# Altium project SX1262_Scan.PrjPcb
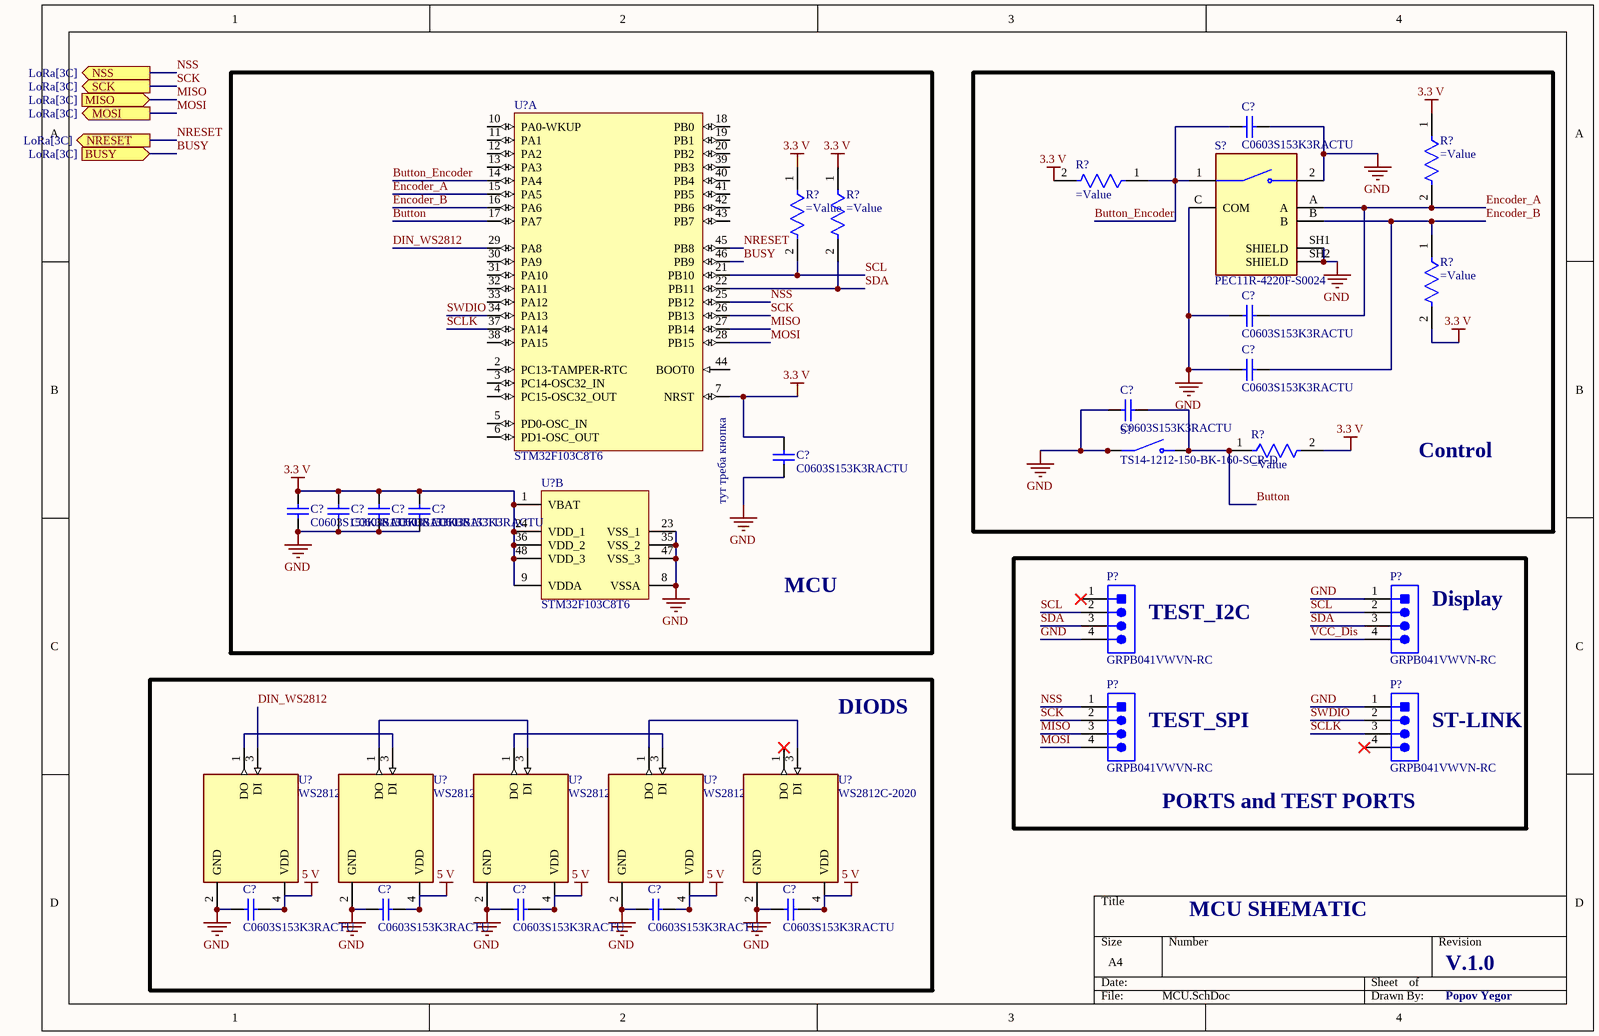
[diagram p0: MCU.SchDoc]
4 sheets, 67 parts. Net scope: flat (ports and power ports of the same name join across sheets).
Sheets:
  Main.SchDoc
  MCU.SchDoc
  LoRa.SchDoc
  Power.SchDoc

## Sheet Main.SchDoc
size A4; SheetNumber: 1; SheetTotal: 3

## Sheet MCU.SchDoc
size A4; SheetNumber: 2; SheetTotal: 4

### Parts
(Parts that share a designator on the sheet are numbered #1, #2 ... from top to bottom, then left to right.)
C?#1  C0603S153K3RACTU  [CAP_0603]
C?#2  C0603S153K3RACTU  [CAP_0603]
C?#3  C0603S153K3RACTU  [CAP_0603]
C?#4  C0603S153K3RACTU  [CAP_0603]
C?#5  C0603S153K3RACTU  [CAP_0603]
C?#6  C0603S153K3RACTU  [CAP_0603]
C?#7  C0603S153K3RACTU  [CAP_0603]
C?#8  C0603S153K3RACTU  [CAP_0603]
C?#9  C0603S153K3RACTU  [CAP_0603]
C?#10  C0603S153K3RACTU  [CAP_0603]
C?#11  C0603S153K3RACTU  [CAP_0603]
C?#12  C0603S153K3RACTU  [CAP_0603]
C?#13  C0603S153K3RACTU  [CAP_0603]
C?#14  C0603S153K3RACTU  [CAP_0603]
P?#1  GRPB041VWVN-RC  [SLIN-GRPB041VWVN-RC_V]
P?#2  GRPB041VWVN-RC  [SLIN-GRPB041VWVN-RC_V]
P?#3  GRPB041VWVN-RC  [SLIN-GRPB041VWVN-RC_V]
P?#4  GRPB041VWVN-RC  [SLIN-GRPB041VWVN-RC_V]
R?#1  (no value)  [Res_0603]
R?#2  (no value)  [Res_0603]
R?#3  (no value)  [Res_0603]
R?#4  (no value)  [Res_0603]
R?#5  (no value)  [Res_0603]
R?#6  (no value)  [Res_0603]
S?#1  PEC11R-4220F-S0024  [XDCR_PEC11R-4220F-S0024]
S?#2  TS14-1212-150-BK-160-SCR-D  [SW_TS14-1212-150-BK-160-SCR-D]
U?#1  STM32F103C8T6  [STM-LQFP48_L]  (part A of 2)
U?#2  STM32F103C8T6  [STM-LQFP48_L]  (part B of 2)
U?#3  WS2812C-2020  [LED_WS2812C-2020]
U?#4  WS2812C-2020  [LED_WS2812C-2020]
U?#5  WS2812C-2020  [LED_WS2812C-2020]
U?#6  WS2812C-2020  [LED_WS2812C-2020]
U?#7  WS2812C-2020  [LED_WS2812C-2020]

### Blocks framed on the sheet
MCU: C?#5-C?#9 R?#2 R?#3 U?#1 U?#2
Control: C?#1-C?#4 R?#1 R?#4-R?#6 S?#1 S?#2
DIODS: C?#10-C?#14 U?#3-U?#7

### Ports
BUSY (in, see LoRa[3C]), MISO (in, see LoRa[3C]), MOSI (out, see LoRa[3C]), NRESET (out, see LoRa[3C]), NSS (out, see LoRa[3C]), SCK (out, see LoRa[3C])

### Nets
3.3 V: C?#5.1 C?#6.1 C?#7.1 C?#8.1 C?#9.1 R?#1.1 R?#2.1 R?#3.1 R?#4.2 R?#5.2 R?#6.2 U?#1.7(NRST) U?#2.1(VBAT) U?#2.9(VDDA) U?#2.24(VDD_1) U?#2.36(VDD_2) U?#2.48(VDD_3)
5 V: C?#10.2 C?#11.2 C?#12.2 C?#13.2 C?#14.2 U?#3.4(VDD) U?#4.4(VDD) U?#5.4(VDD) U?#6.4(VDD) U?#7.4(VDD)
GND: C?#1.1 C?#2.2 C?#3.2 C?#4.1 C?#5.2 C?#6.2 C?#7.2 C?#8.2 C?#9.2 C?#10.1 C?#11.1 C?#12.1 C?#13.1 C?#14.1 P?#1.4 P?#2.1 P?#4.1 S?#1.2 S?#1.C(COM) S?#1.SH1(SHIELD) S?#1.SH2(SHIELD) S?#2.3(COM) S?#2.4(COM) U?#2.8(VSSA) U?#2.23(VSS_1) U?#2.35(VSS_2) U?#2.47(VSS_3) U?#3.2(GND) U?#4.2(GND) U?#5.2(GND) U?#6.2(GND) U?#7.2(GND)
BUSY: U?#1.46(PB9) ; port BUSY
Button: C?#4.2 R?#6.1 S?#2.1(NO) S?#2.2(NO) U?#1.17(PA7)
Button_Encoder: C?#1.2 R?#4.1 S?#1.1 U?#1.14(PA4)
DIN_WS2812: U?#1.29(PA8) U?#3.3(DI)
Encoder_A: C?#2.1 R?#1.2 S?#1.A U?#1.15(PA5)
Encoder_B: C?#3.1 R?#5.1 S?#1.B U?#1.16(PA6)
MISO: P?#3.3 U?#1.27(PB14) ; port MISO
MOSI: P?#3.4 U?#1.28(PB15) ; port MOSI
NRESET: U?#1.45(PB8) ; port NRESET
NSS: P?#3.1 U?#1.25(PB12) ; port NSS
SCK: P?#3.2 U?#1.26(PB13) ; port SCK
SCL: P?#1.2 P?#2.2 R?#2.2 U?#1.21(PB10)
SCLK: P?#4.3 U?#1.37(PA14)
SDA: P?#1.3 P?#2.3 R?#3.2 U?#1.22(PB11)
SWDIO: P?#4.2 U?#1.34(PA13)
VCC_Dis: P?#2.4
NetU?#3_1: U?#3.1(DO) U?#4.3(DI)
NetU?#4_1: U?#4.1(DO) U?#5.3(DI)
NetU?#5_1: U?#5.1(DO) U?#6.3(DI)
NetU?#6_1: U?#6.1(DO) U?#7.3(DI)

Not connected (* = marked no-connect by the designer): P?#1 1*; P?#4 4*; U?#1 2(PC13-TAMPER-RTC) 3(PC14-OSC32_IN) 4(PC15-OSC32_OUT) 5(PD0-OSC_IN) 6(PD1-OSC_OUT) 10(PA0-WKUP) 11(PA1) 12(PA2) 13(PA3) 18(PB0) 19(PB1) 20(PB2) 30(PA9) 31(PA10) 32(PA11) 33(PA12) 38(PA15) 39(PB3) 40(PB4) 41(PB5) 42(PB6) 43(PB7) 44(BOOT0); U?#7 1(DO)*

### Notes on the sheet
- (near U?#1) тут треба кнопка
- (near P?#1) TEST_I2C
- (near P?#2) Display
- (near P?#3) TEST_SPI
- (near P?#4) ST-LINK
- (near P?#4) PORTS and TEST PORTS
- MCU SHEMATIC
- V.1.0
- Popov Yegor

### Library data of the parts
C?#1-C?#14 = CAP_0603: Manufacturer: Kemet; Part Number: C0603S153K3RACTU
P?#1-P?#4 = CMP-2000-06373-1: Male Header, Pitch 1.27 mm, 1 x 4 Position, Height 4 mm, Tail Length 2.3 mm, -40 to 105 degC, RoHS, Bulk; Manufacturer: Sullins; Mating Products: S9010E-04-ND / -CONNHEADER.050"4POSR/APCB / S9008E-04-ND / -CONNHEADER.050"4POSPCBGOLD / S9005E-04-ND / -CONNHEADER.050"4POSSMDGOLD; Other Names: S9014E-04; Dynamic Catalog: GRPB; Pitch: 0.050"(1.27mm); Number of Positions Loaded: All; Number of Positions: 4; Catalog Drawings: S9014ESeriesTop; Connector Type: Header,Unshrouded; Contact Finish Thickness: Flash; Number of Rows: 1; Contact Type: MalePin; Category: Connectors,Interconnects; Contact Mating Length: 0.118"(3.00mm); Family: RectangularConnectors-Headers,MalePins; Datasheet Version: Rev. C, 12/2008; Contact Finish: Gold; Termination: Solder; Manufacturer URL: http://www.sullinscorp.com/; Mounting Type: ThroughHole; Packaging: Bulk; Package Reference: GRPB041VWVN-RC; Datasheet URL: http://www.sullinscorp.com/drawings/71_GRPB___1VWVN-RC,_10957-C.pdf; Mounting Technology: ThroughHole; Package Description: Male Header, Pitch 1.27 mm, 1 x 4 Position, Height 4 mm, Tail Length 2.3 mm; Standard Package: 1
R?#1-R?#6 = R_0603: 1.54kΩ ±1% 0.1W 0603 Thick Film Chip Resistor AEC-Q200 compliant; Resistance: 1.54kR; Temperature Coefficient: 200ppm/°C; Max Operating Temperature: 155°C; Radiation Hardening: No; Packaging: Tape and Reel; Case/Package: 0603; Min Operating Temperature: -55°C; Mount: Surface Mount; Resistor Type: Thick Film; Tolerance: 1%; RoHS Compliant: Yes
S?#1 = PEC11R-4220F-S0024: MF: {'manufacturer': u'Bourns Inc.'}; Package: None; Price: None; Value: *; MP: PEC11R-4220F-S0024; Availability: Unavailable
S?#2 = TS14-1212-150-BK-160-SCR-D: 12 x 12 mm, 15 mm Actuator Height, 160 gf, Short Crimped, Black, Through Hole, SPST, Tactile Switch; MF: Same Sky; SnapEDA_Link: https://www.snapeda.com/parts/TS14-1212-150-BK-160-SCR-D/Same+Sky/view-part/?ref=snap; Package: None; Value: *; MP: TS14-1212-150-BK-160-SCR-D; Check_prices: https://www.snapeda.com/parts/TS14-1212-150-BK-160-SCR-D/Same+Sky/view-part/?ref=eda
U?#1 U?#2 = CMP-0237-00215-3: ARM Cortex-M3 32-bit MCU, 64 KB Flash, 20 KB Internal RAM, 37 I/Os, 48-pin LQFP, -40 to 85 degC, Tray; Supply Voltage(Vcc) min (V): 2; Internal RAM Size (kB): 20; FLASH Size (Prog) (kB): 64; A/D Converter: 2x12-bit (10 Channel); I/Os (High Current): 37; Operating Frequency(F) (Processor speed) (MHz): 72; Core: ARM Cortex-M3; ComponentLink3Description: Package Specification; Mounting Technology: Surface Mount; PartNumber: STM32F103C8T6; PackageReference: LQFP48; Packing: Tray; ComponentLink3URL: http://www.st.com/st-web-ui/static/active/en/resource/technical/document/datasheet/DM00058181.pdf; DatasheetVersion: Rev. 16; ComponentLink1URL: http://www.st.com/web/en/home.html; PackageVersion: Rev. 6, 06/2013; ComponentLink2URL: http://www.st.com/st-web-ui/static/active/en/resource/technical/document/datasheet/CD00161566.pdf; ComponentLink1Description: Manufacturer URL; ComponentLink2Description: Datasheet; PackageDescription: 48-Pin Low Profile Quad Flat Package, 7 x 7 mm Body, 0.5 mm Pitch
U?#3-U?#7 = WS2812C-2020: Intelligent control LED integrated light source; MF: Worldsemi; SnapEDA_Link: https://www.snapeda.com/parts/WS2812C-2020/Worldsemi/view-part/?ref=snap; Package: Package; Value: *; MP: WS2812C-2020; Check_prices: https://www.snapeda.com/parts/WS2812C-2020/Worldsemi/view-part/?ref=eda

## Sheet LoRa.SchDoc
size A4; SheetNumber: 3; SheetTotal: 4
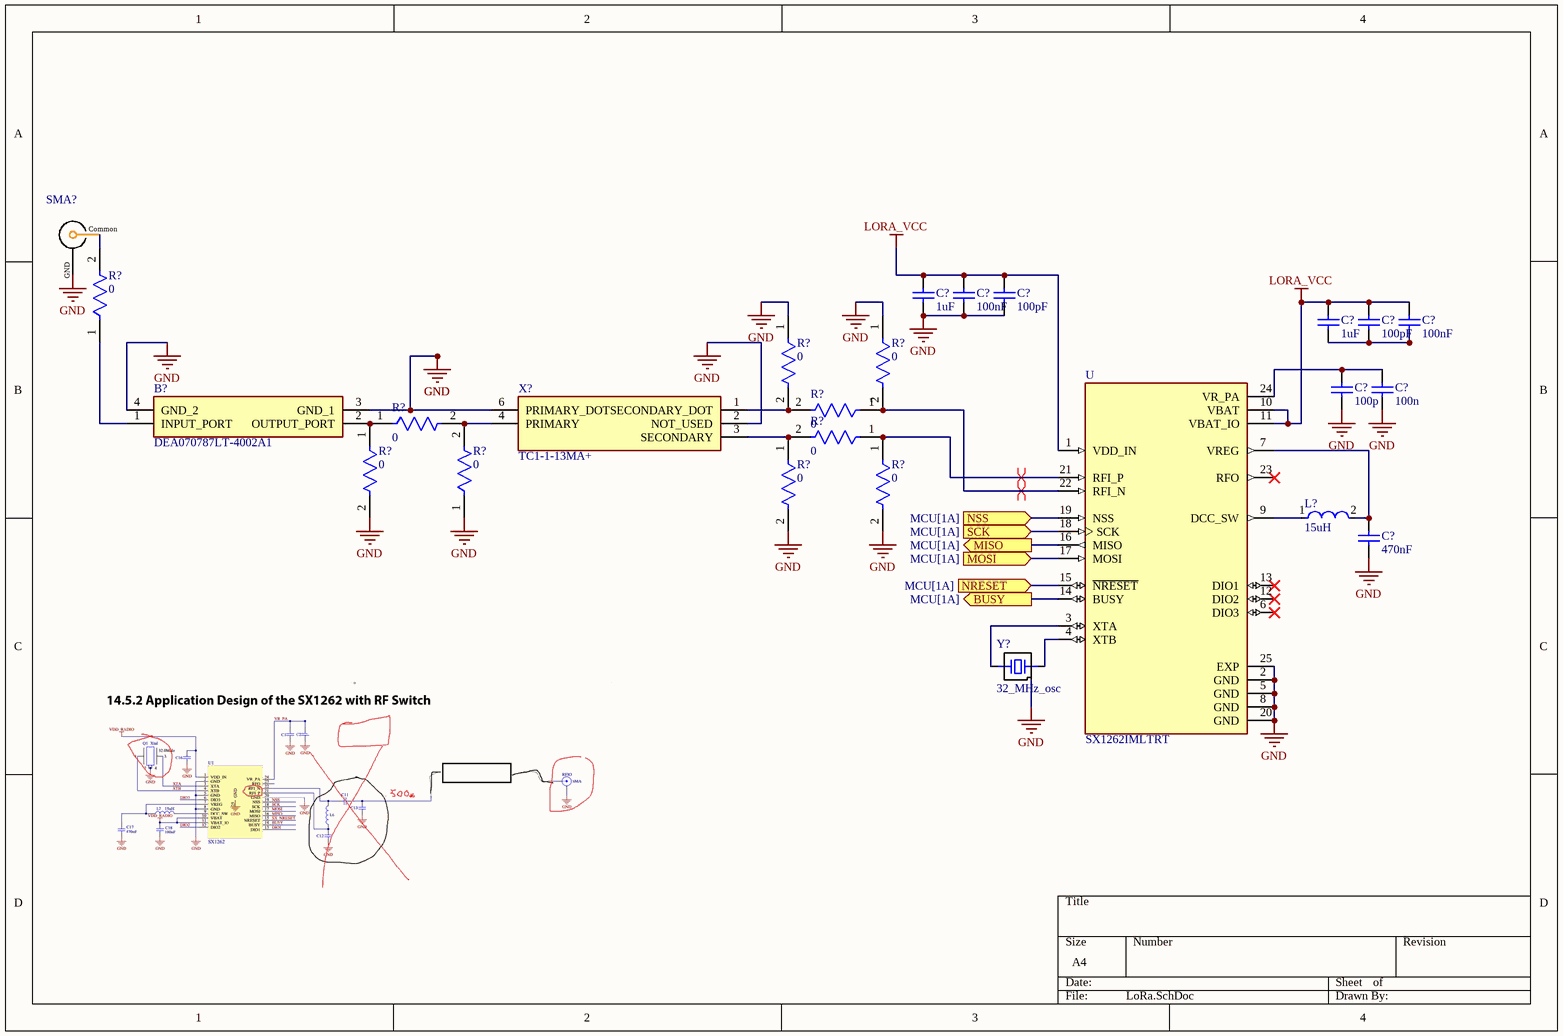
[diagram p1: LoRa.SchDoc]

### Parts
(Parts that share a designator on the sheet are numbered #1, #2 ... from top to bottom, then left to right.)
B?#1  DEA070787LT-4002A1  [DEA070787LT4002A1]
C?#15  1uF  [CAP_0402]
C?#16  100nF  [CAP_0402]
C?#17  100pF  [CAP_0402]
C?#18  1uF  [CAP_0402]
C?#19  100pF  [CAP_0402]
C?#20  100nF  [CAP_0402]
C?#21  100p  [CAP_0402]
C?#22  100n  [CAP_0402]
C?#23  470nF  [CAP_0402]
L?  15uH  [L_0402]
R?#7  0  [Res_0402]
R?#8  0  [Res_0402]
R?#9  0  [Res_0402]
R?#10  0  [Res_0402]
R?#11  0  [Res_0402]
R?#12  0  [Res_0402]
R?#13  0  [Res_0402]
R?#14  0  [Res_0402]
R?#15  0  [Res_0402]
R?#16  0  [Res_0402]
SMA?  SMA  [SMA_BWSMA-KE11]  (value not drawn)
U  SX1262IMLTRT  [QFN50P400X400X100-25N]
X?  TC1-1-13MA+  [TC1113MA]
Y?  32_MHz_osc  [SMD3225-4P]

### Ports
BUSY (out, see MCU[1A]), MISO (out, see MCU[1A]), MOSI (in, see MCU[1A]), NRESET (in, see MCU[1A]), NSS (in, see MCU[1A]), SCK (in, see MCU[1A])

### Nets
GND: B?#1.3(GND_1) B?#1.4(GND_2) C?#15.1 C?#16.1 C?#17.1 C?#21.1 C?#22.1 C?#23.1 R?#7.1 R?#8.1 R?#12.2 R?#13.2 R?#15.2 R?#16.1 SMA?.GND U.2(GND) U.5(GND) U.8(GND) U.20(GND) U.25(EXP) X?.2(NOT_USED) X?.6(PRIMARY_DOT) Y?.GND
LORA_VCC: C?#15.2 C?#16.2 C?#17.2 C?#18.2 C?#19.2 C?#20.2 U.1(VDD_IN) U.10(VBAT) U.11(VBAT_IO)
BUSY: U.14(BUSY) ; port BUSY
MISO: U.16(MISO) ; port MISO
MOSI: U.17(MOSI) ; port MOSI
NRESET: U.15(~{NRESET}) ; port NRESET
NSS: U.19(NSS) ; port NSS
SCK: U.18(SCK) ; port SCK
NetB?#1_1: B?#1.1(INPUT_PORT) R?#9.1
NetB?#1_2: B?#1.2(OUTPUT_PORT) R?#11.1 R?#12.1
NetC?#18_1: C?#18.1 C?#19.1 C?#20.1
NetC?#21_2: C?#21.2 C?#22.2 U.24(VR_PA)
NetC?#23_2: C?#23.2 L?.2 U.7(VREG)
NetL?_1: L?.1 U.9(DCC_SW)
NetR?#7_2: R?#7.2 R?#10.2 X?.1(SECONDARY_DOT)
NetR?#8_2: R?#8.2 R?#10.1 U.22(RFI_N)
NetR?#9_2: R?#9.2 SMA?.Common
NetR?#11_2: R?#11.2 R?#16.2 X?.4(PRIMARY)
NetR?#13_1: R?#13.1 R?#14.2 X?.3(SECONDARY)
NetR?#14_1: R?#14.1 R?#15.1 U.21(RFI_P)
NetU_3: U.3(XTA) Y?.IN
NetU_4: U.4(XTB) Y?.OUT

Not connected (* = marked no-connect by the designer): U 6(DIO3)* 12(DIO2)* 13(DIO1)* 23(RFO)*

### Layout directives
differential pair: NetR?#8_2, NetR?#14_1

### Library data of the parts
B?#1 = DEA070787LT-4002A1: Filters, Pass Band=777 to 787MHz, Zc=50se; Manufacturer_Name: TDK; Geometry.Height: 0.3mm; Mouser Part Number: 810-DEA070787LT42A1; Mouser Price/Stock: https://www.mouser.co.uk/ProductDetail/TDK/DEA070787LT-4002A1?qs=t7xnP681wgWsMS%252BzXDdMJg%3D%3D; Manufacturer_Part_Number: DEA070787LT-4002A1; Datasheet Link: https://product.tdk.com/system/files/dam/doc/product/rf/rf/filter/catalog/rf_lpf_dea070787lt-4002a1_en.pdf
C?#15-C?#23 = CAP_0402: Part Number: C0402T103K4RACTU; Manufacturer: Kemet
  C?#15 C?#18: Value: 1uF
  C?#16 C?#20: Value: 100nF
  C?#17 C?#19: Value: 100pF
  C?#21: Value: 100p
  C?#22: Value: 100n
  C?#23: Value: 470nF
L? = L_0402: Wire Wound Ferrite type RF Inductor 140nH ±5% 650mA 0.216Ω 0402 (1005); Value: 15uH
R?#7-R?#16 = R_0402: RES SMD 1.2K OHM 1% 1/10W 0402; Resistance: 12400R; Tolerance: 1%; Lead Free: Lead Free; Width: 500um; Length: 1mm; Height: 320um; Case/Package: 0402; Value: 0
SMA? = BWSMA-KE11: SMD_or_DIP: SMD; Vertical_or_Horizontal: Horizontal; Value: SMD_Horizontal; Part Number: BWSMA-KE11; JLCPCB Part #: C5250058; Connector_Type: SMA; Max_Frequency: ?; ComponentLink1URL: https://jlcpcb.com/api/file/downloadByFileSystemAccessId/8590456158969360384; ComponentLink1Description: Datasheet; JLCRotOffset: -90
U = SX1262IMLTRT: IC RF TxRx Only General ISM < 1GHz LoRaWAN 150MHz ~ 960MHz 24-VFQFN Exposed Pad; MF: Semtech Corporation; Value: *; SnapEDA_Link: https://www.snapeda.com/parts/SX1262IMLTRT/Semtech%20Corporation/view-part/2781045/?ref=snap; Availability: Unavailable; Package: VFQFN-24 Semtech; Price: None; MP: SX1262IMLTRT
X? = TC1-1-13MA+: RF TRANSFORMER, 4.5 - 3000 MHZ,; Manufacturer_Name: Mini-Circuits; Geometry.Height: 4.06mm; Mouser Part Number: 139-TC1-1-13MA; Mouser Price/Stock: https://www.mouser.co.uk/ProductDetail/Mini-Circuits/TC1-1-13MA%2b?qs=xZ%2FP%252Ba9zWqaQyucfPXsKqA%3D%3D; Manufacturer_Part_Number: TC1-1-13MA+; Datasheet Link: TC1-1-13MA+
Y? = X322532MOB4SI: frequency_(MHz): 32; Part Number: X322532MOB4SI; JLCPCB Part #: C9009; Value: 32_MHz_osc; ComponentLink1URL: https://jlcpcb.com/api/file/downloadByFileSystemAccessId/8588879124404715520; ComponentLink1Description: Datasheet

## Sheet Power.SchDoc
size A4; SheetNumber: 4; SheetTotal: 4
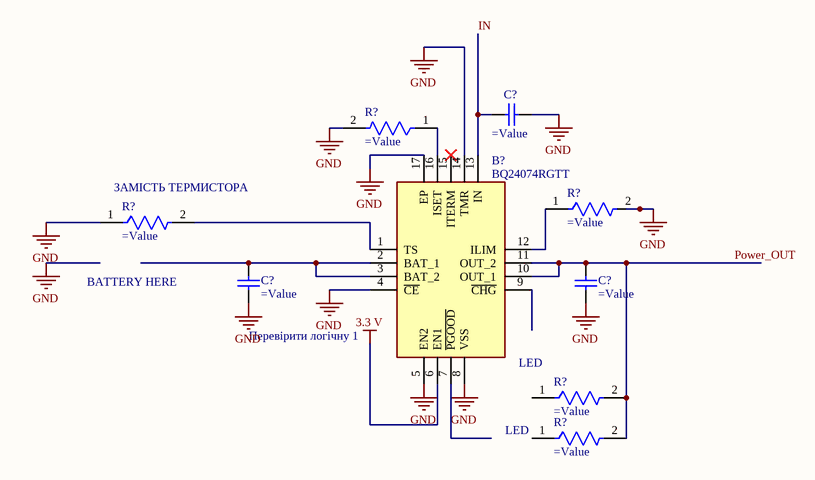
[diagram p2: Power.SchDoc]

### Parts
(Parts that share a designator on the sheet are numbered #1, #2 ... from top to bottom, then left to right.)
B?#2  BQ24074RGTT  [QFN50P300X300X100-17N-D]
C?#24  (no value)  [CAP_0603]
C?#25  (no value)  [CAP_0603]
C?#26  (no value)  [CAP_0603]
R?#17  (no value)  [Res_0603]
R?#18  (no value)  [Res_0603]
R?#19  (no value)  [Res_0603]
R?#20  (no value)  [Res_0603]
R?#21  (no value)  [Res_0603]

### Nets
3.3 V: B?#2.6(EN1)
GND: B?#2.4(~{CE}) B?#2.5(EN2) B?#2.8(VSS) B?#2.14(TMR) B?#2.17(EP) C?#24.2 C?#25.1 C?#26.1 R?#17.2 R?#18.2 R?#19.1
IN: B?#2.13(IN) C?#24.1
Power_OUT: B?#2.10(OUT_1) B?#2.11(OUT_2) C?#26.2 R?#20.2 R?#21.2
NetB?#2_1: B?#2.1(TS) R?#19.2
NetB?#2_2: B?#2.2(BAT_1) B?#2.3(BAT_2) C?#25.2
NetB?#2_12: B?#2.12(ILIM) R?#18.1
NetB?#2_16: B?#2.16(ISET) R?#17.1

Not connected (* = marked no-connect by the designer): B?#2 7(~{PGOOD}) 9(~{CHG}) 15(ITERM)*; R?#20 1; R?#21 1

### Notes on the sheet
- (near R?#19) ЗАМІСТЬ ТЕРМИСТОРА
- BATTERY HERE
- Перевірити логічну 1
- (near B?#2) LED
- (near R?#21) LED

### Library data of the parts
B?#2 = BQ24074RGTT: USB-Friendly Li-Ion Battery Charger and Power-Path Management IC, 10.5V OVP; Manufacturer_Name: Texas Instruments; Geometry.Height: 1mm; Mouser Part Number: 595-BQ24074RGTT; Mouser Price/Stock: https://www.mouser.co.uk/ProductDetail/Texas-Instruments/BQ24074RGTT?qs=ZV%2Fxhq4oszp0gb4MsbpFYw%3D%3D; Manufacturer_Part_Number: BQ24074RGTT; Datasheet Link: http://www.ti.com/lit/gpn/bq24074
C?#24-C?#26 = CAP_0603: Manufacturer: Kemet; Part Number: C0603S153K3RACTU
R?#17-R?#21 = R_0603: as R?#1 on sheet MCU; Max Operating Temperature: 155°C; Radiation Hardening: No; Packaging: Tape and Reel; Case/Package: 0603; Min Operating Temperature: -55°C; Mount: Surface Mount; Resistor Type: Thick Film; Tolerance: 1%; RoHS Compliant: Yes

## Nets that join several sheets
3.3 V: MCU (17 pins), Power (B?#2.6)
GND: MCU (32 pins), LoRa (23 pins), Power (11 pins)
BUSY: MCU (U?#1.46), LoRa (U.14)
MISO: MCU (P?#3.3 U?#1.27), LoRa (U.16)
MOSI: MCU (P?#3.4 U?#1.28), LoRa (U.17)
NRESET: MCU (U?#1.45), LoRa (U.15)
NSS: MCU (P?#3.1 U?#1.25), LoRa (U.19)
SCK: MCU (P?#3.2 U?#1.26), LoRa (U.18)